# Altium schematic sheet [08] - PUSH BUTTONS LEDS AND RESET.SchDoc
size A2; DocumentNumber: 2; SheetNumber: 8; SheetTotal: 10
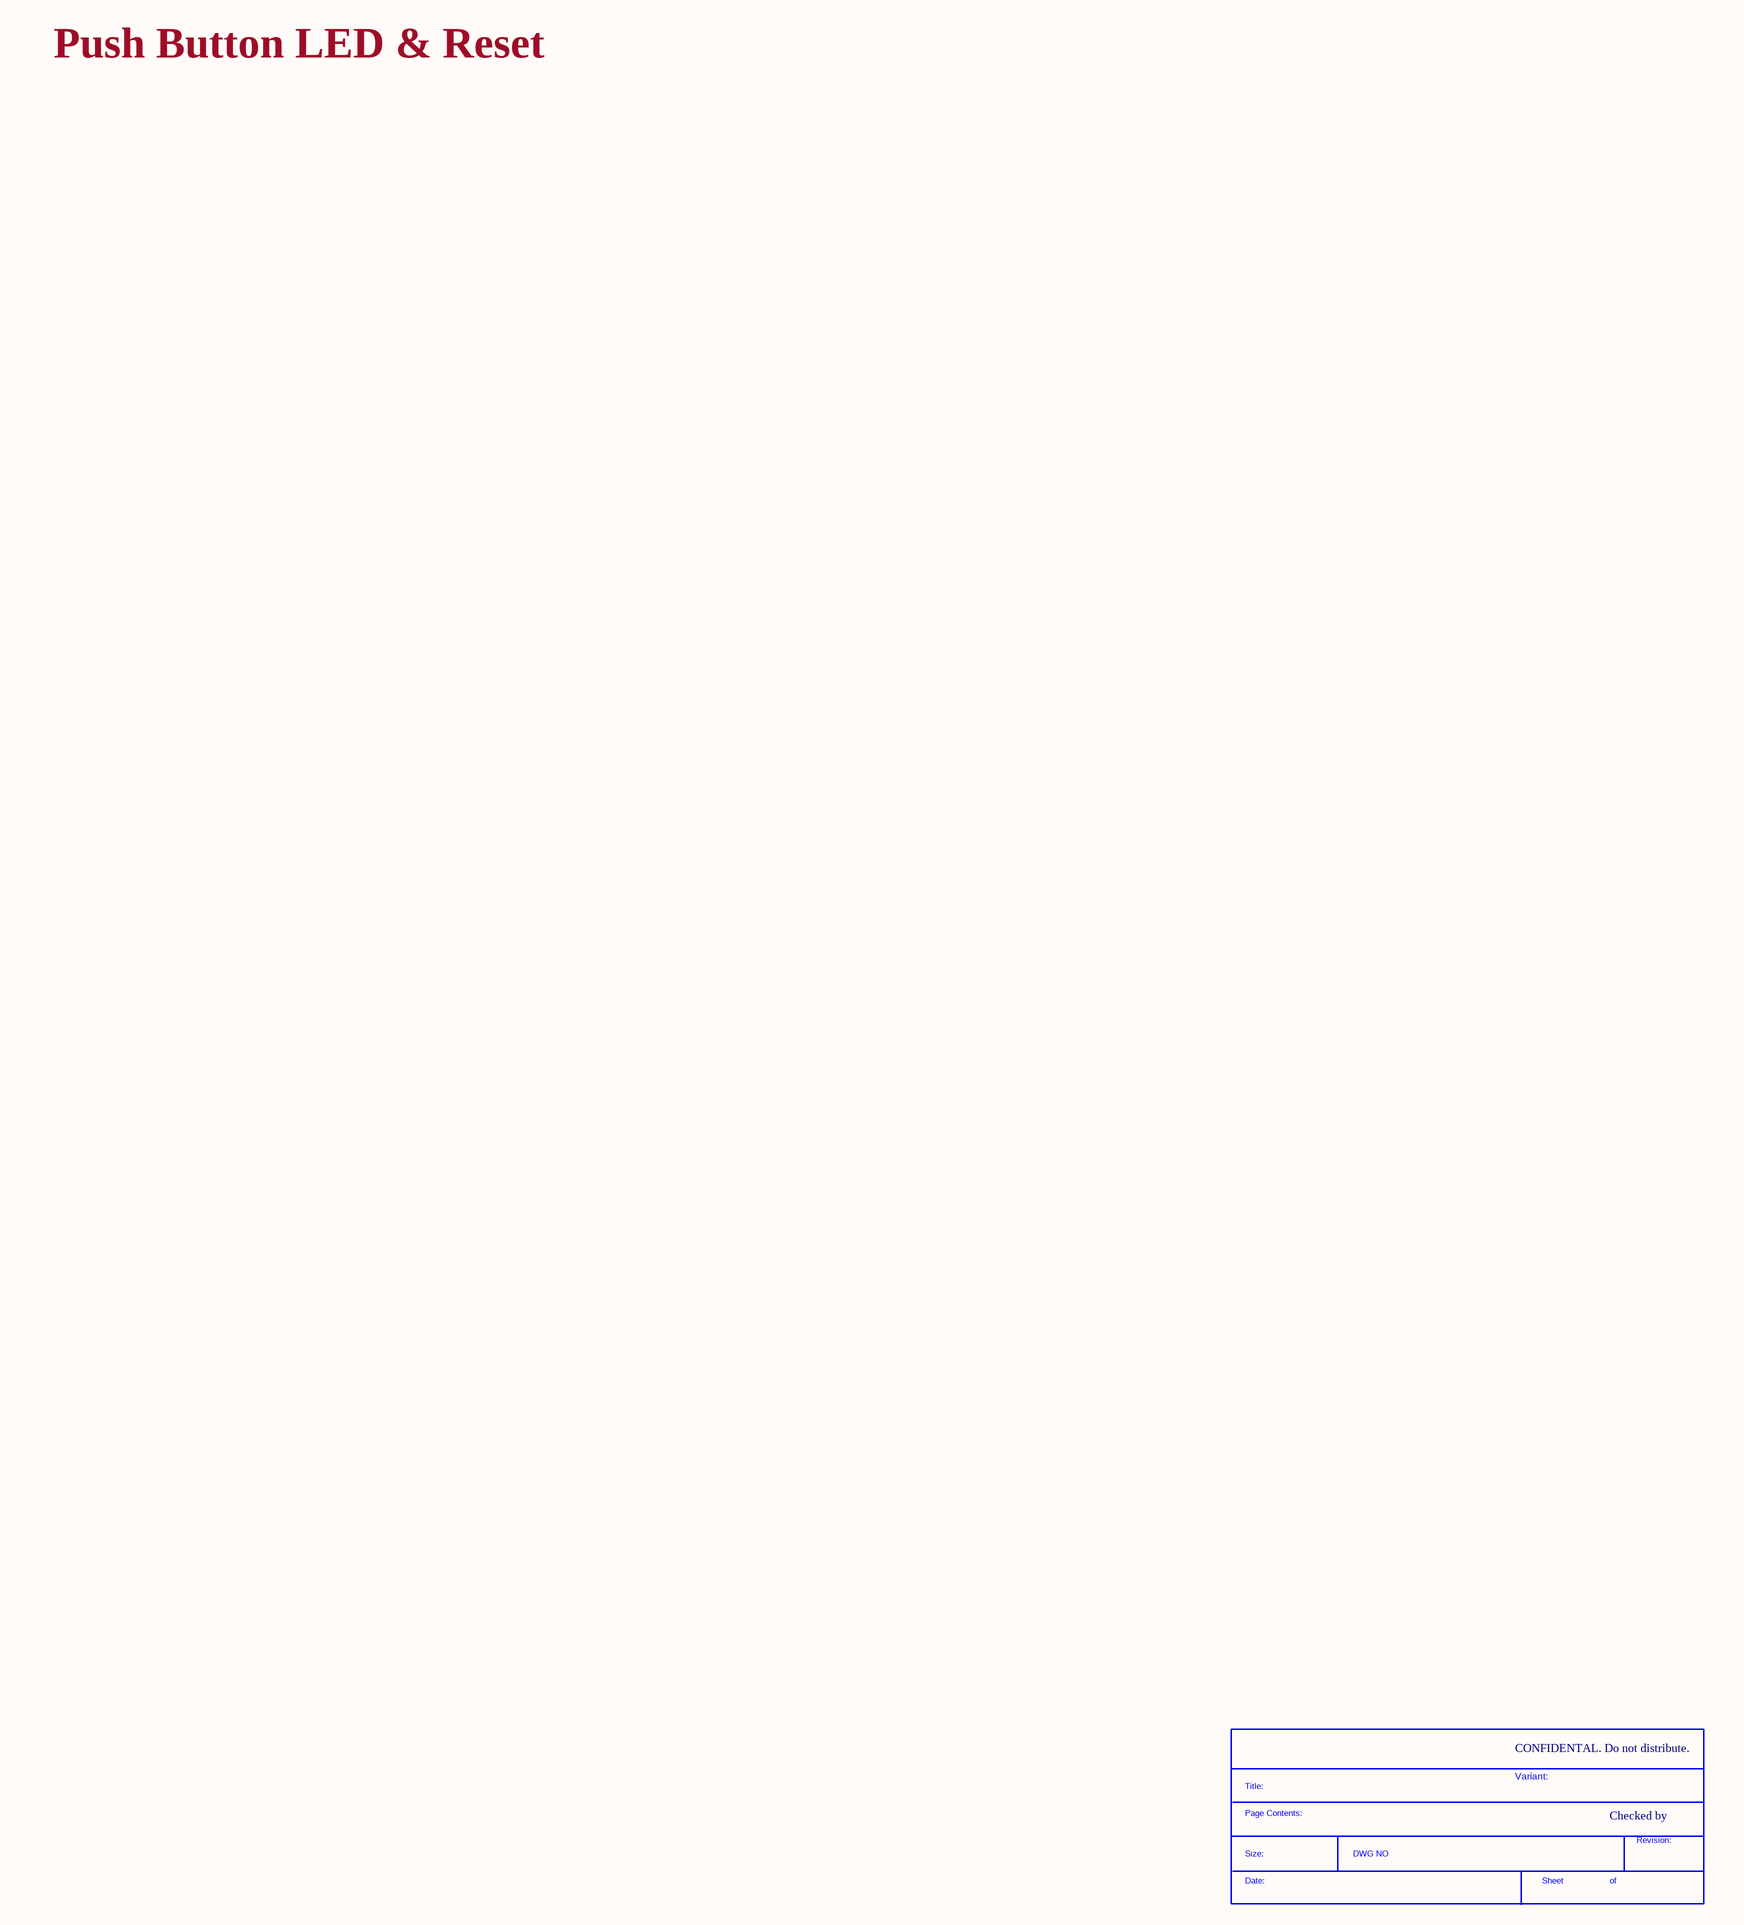
[diagram p0: [08] - PUSH BUTTONS LEDS AND RESET.SchDoc]

## Parts
*  SDTitleBlock  (value not drawn)  (graphical)

## Notes on the sheet
- Push Button LED & Reset
- CONFIDENTAL. Do not distribute.
- Variant:
- Checked by
- (in symbol SDTitleBlock) Title:; Page Contents:; Revision:; Size:; DWG NO; Date:; Sheet; of